# EasyEDA Pro project ProProject_F4_2025-05-21.epro, schematic Schematic3
Create Date: 2024-12-17; Page Name: P1; Project Name: 25电赛备赛; Schematic Name: Schematic3; Update Date: 2025-01-24; Company: 嘉立创EDA; Page Size: A4; Version: V1.0
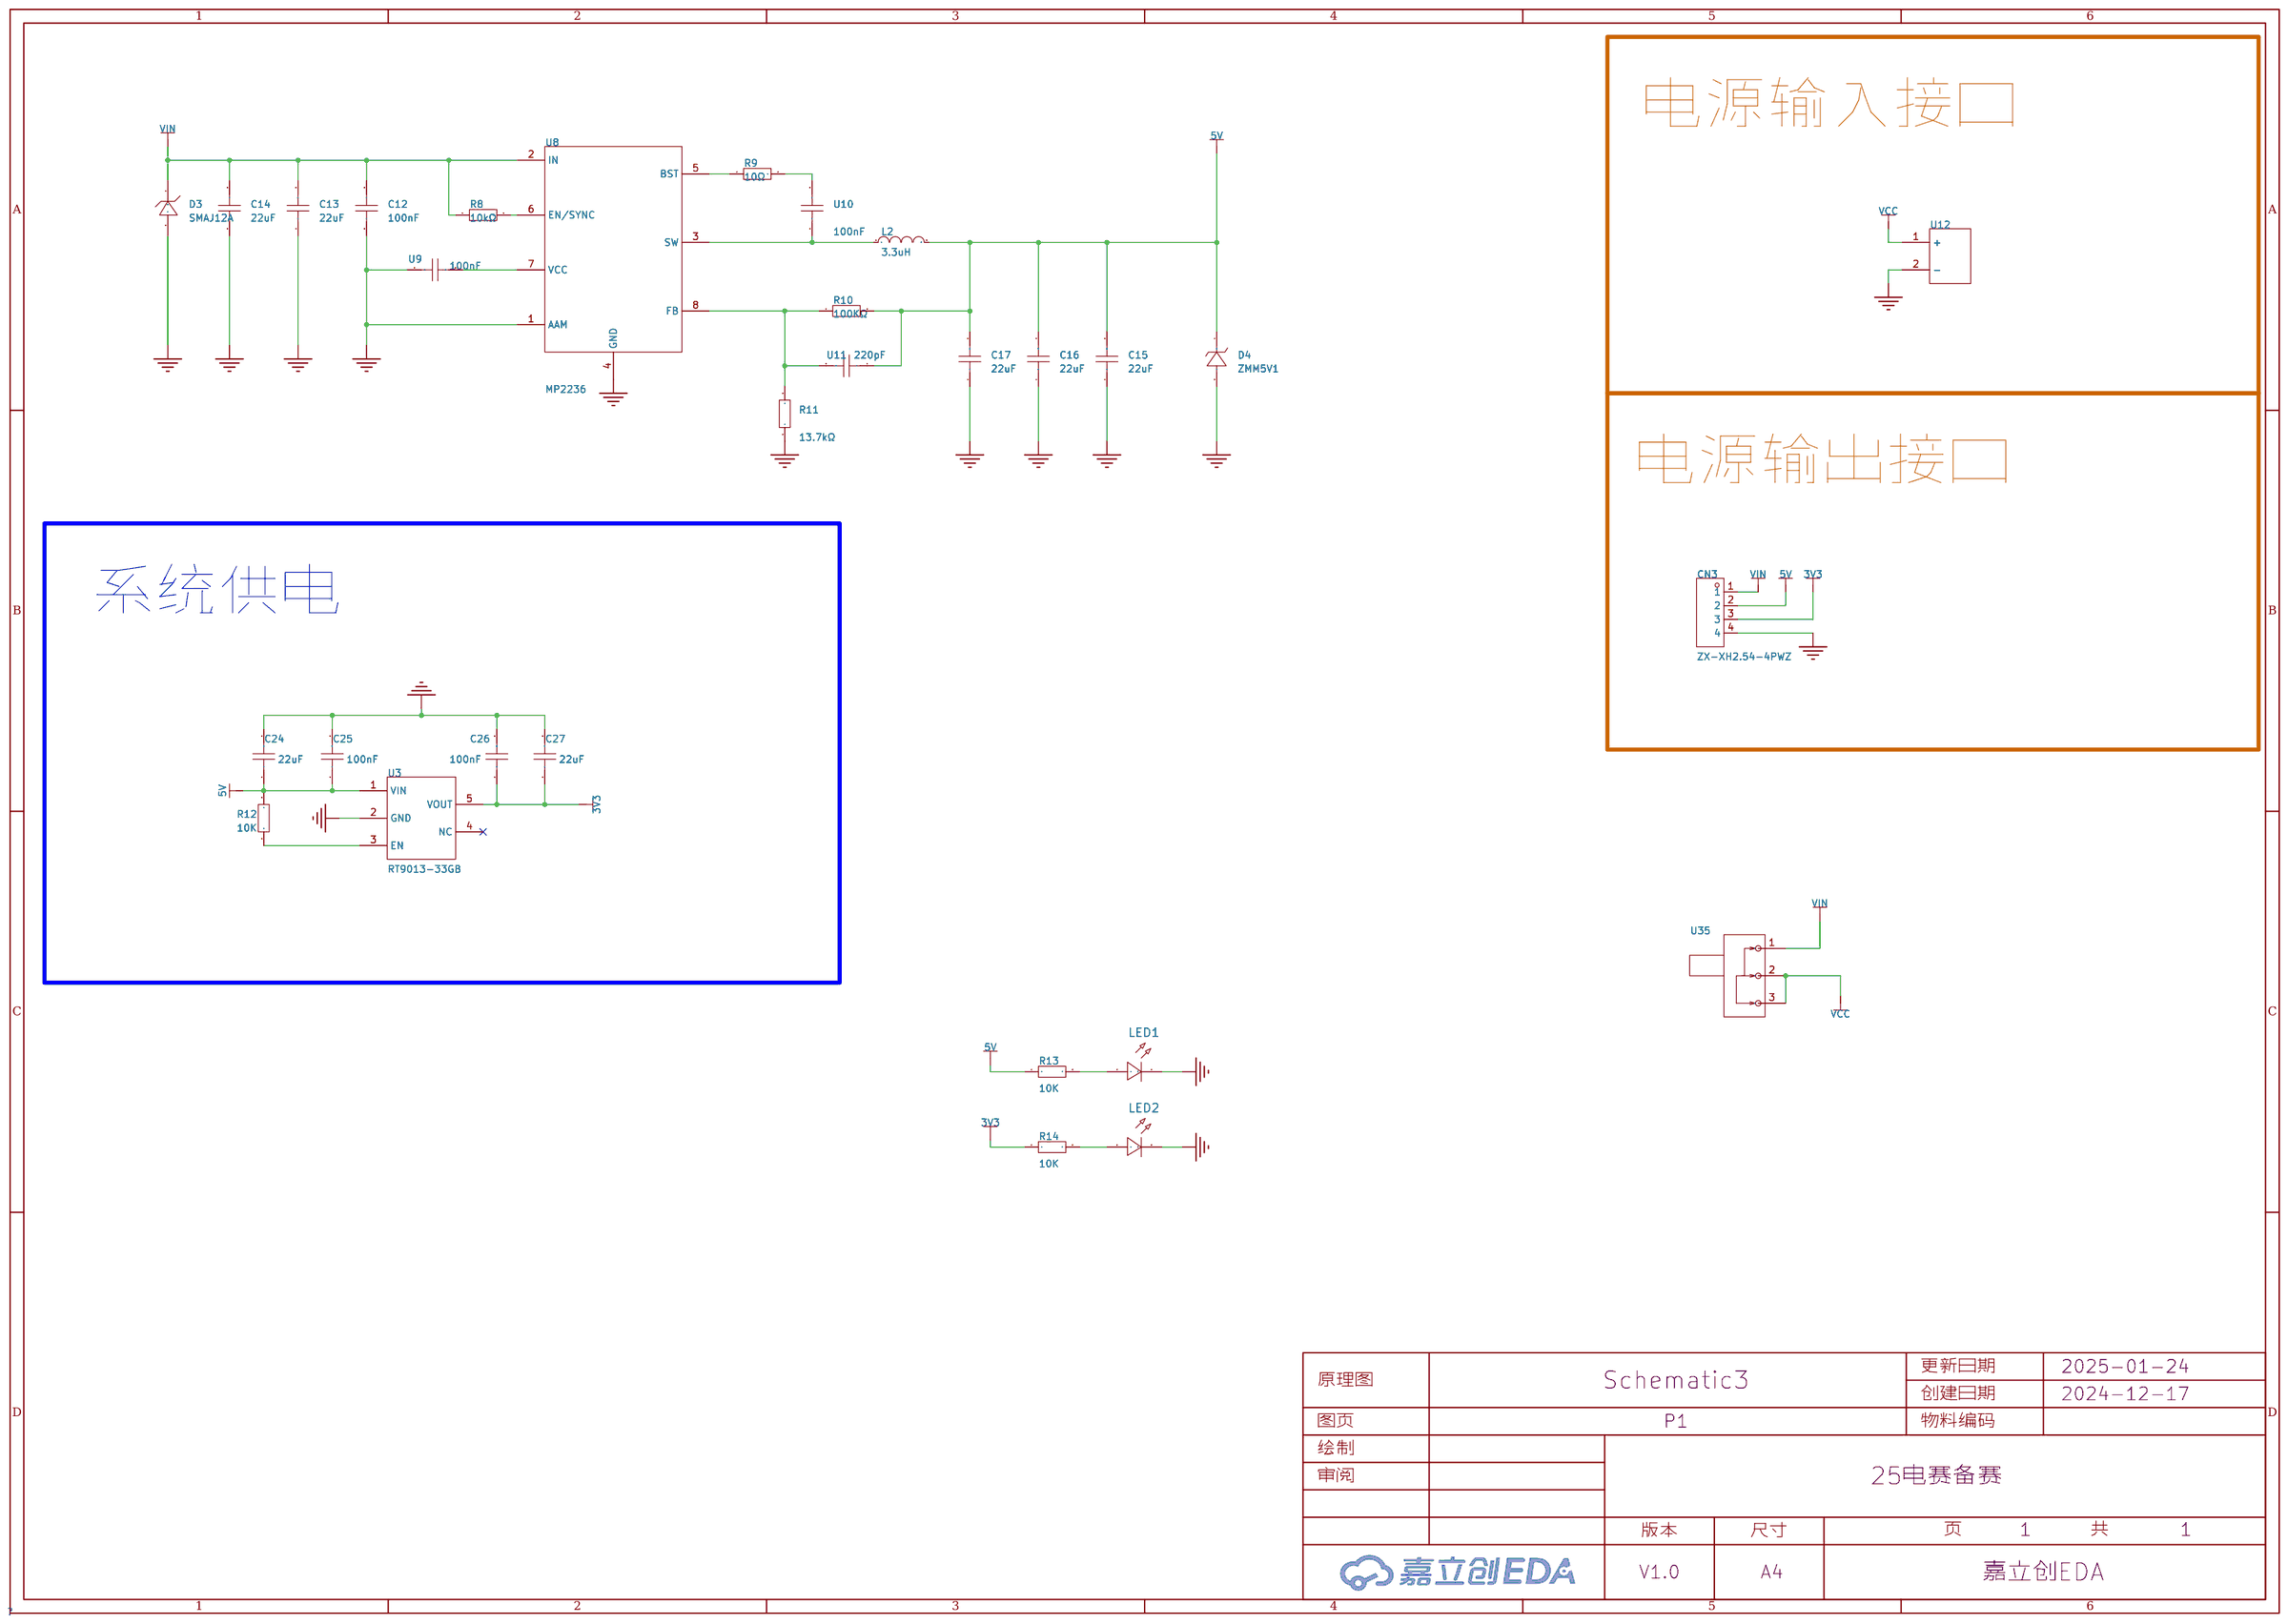
[diagram p2: schematic sheet]

## Parts
C12  100nF  [C0805]
C13  22uF  [C0805]
C14  22uF  [C0805]
C15  22uF  [C0805]
C16  22uF  [C0805]
C17  22uF  [C0805]
C24  22uF  [C0805]
C25  100nF  [C0603]
C26  100nF  [C0603]
C27  22uF  [C0805]
CN3  ZX-XH2.54-4PWZ  [CONN-TH_4P-P2.50_ZX-XH2.54-4PWZ]
D3  SMAJ12A  [SMA_L4.3-W2.6-LS5.2-RD]
D4  ZMM5V1  [LL-34_L3.5-W1.5-RD]
L2  3.3uH  [IND-SMD_L7.0-W6.6]
LED1  -  [LED_0603]
LED2  -  [LED_0603]
R8  10kΩ  [R0603]
R9  10Ω  [R0603]
R10  100KΩ  [R0603]
R11  13.7kΩ  [R0603]
R12  10K  [R0603]
R13  10K  [R0603]
R14  10K  [R0603]
U3  RT9013-33GB  [SOT-23-5_L3.0-W1.7-P0.95-LS2.8-BL]
U8  MP2236  [TSOT23-8]
U9  100nF  [C0603]
U10  100nF  [C0603]
U11  220pF  [C0603]
U12  -  [T插-卧]
U35  -  [12d18a]

## Library data of the parts
C12-C17 C24 C27 = 0805DS106K250NT: LCSC Part Name: 贴片电容; Supplier Part: C18213216; Manufacturer: FH(风华); Supplier Footprint: 0805; Datasheet: https://atta.szlcsc.com/upload/public/pdf/source/20220211/3FDF6092789FC56E23A16E03DC7301F9.pdf; Supplier: LCSC
C25 C26 = CAP_0603: Supplier Footprint: 0603
CN3 = ZX-XH2.54-4PWZ: 插针结构:1x4P;间距:2.54mm;安装方式:弯插;参考系列:XH;总PIN数:4P;排数:1;每排PIN数:4;行距:-;额定电流:3A;触头材质:黄铜;触头镀层:锡;工作温度范围:-25℃~+85℃;; Supplier Part: C7429643; Manufacturer: Megastar(兆星); Supplier Footprint: 弯插,P=2.54mm; JLCPCB Part Class: 扩展库; Datasheet: https://atta.szlcsc.com/upload/public/pdf/source/20230619/8DC602C7BA46C153FF1BE89D90453879.pdf; Supplier: LCSC; Pins Structure: 1x4P; Pitch: 2.54mm; Mounting Style: 弯插; Reference Series: XH; Number of Pins: 4P; Number of Rows: 1; Number of PINs Per Row: 4; Current Rating (Max): 3A; Contact Material: 黄铜; Contact Plating: 锡; Operating Temperature Range: -25℃~+85℃
D3 = SMAJ12A_C148213: 极性:单向;反向截止电压(Vrwm):12V;最大钳位电压:19.9V;峰值脉冲电流(Ipp)@10/1000us:20.1A;峰值脉冲功率(Ppp)@10/1000us:400W;击穿电压:13.3V;; LCSC Part Name: 单向TVS 12V截止; Supplier Part: C148213; Manufacturer: Littelfuse(美国力特); Supplier Footprint: SMA(DO-214AC); JLCPCB Part Class: 扩展库; Datasheet: https://atta.szlcsc.com/upload/public/pdf/source/20190402/C374025_5ACE77BC72947DF13CF0CBC7F8B57228.pdf; Supplier: LCSC; polarity: 单向; Reverse Stand-Off Voltage (Vrwm): 12V; Maximum Clamping Voltage: 19.9V; Peak Pulse Current (Ipp)@10/1000us: 20.1A; Peak Pulse Power Dissipation (Ppp)@10/1000us: 400W; Breakdown Voltage: 13.3V; Type: TVS
D4 = ZMM5V1_C707194: 稳压值(标称值):-;功率(Pd):500mW;; Supplier Part: C707194; Manufacturer: Slkor(萨科微); Supplier Footprint: LL-34; JLCPCB Part Class: 扩展库; Datasheet: https://atta.szlcsc.com/upload/public/pdf/source/20200721/C707184_776B95022AAA01ECB528B9CFDAFDB27C.pdf; Supplier: LCSC; Reverse Leakage Current (Ir): 100nA@1V; Power Dissipation: 500mW
L2 = FXL0630-3R3-M: 电感值:3.3uH;精度:±20%;额定电流:8.5A;饱和电流(Isat):9.5A;类型:一体成型电感;; LCSC Part Name: 3.3uH ±20% 9.5A; Supplier Part: C167219; Manufacturer: cjiang(长江微电); Supplier Footprint: SMD,6.6x7mm; JLCPCB Part Class: 扩展库; Datasheet: https://atta.szlcsc.com/upload/public/pdf/source/20230516/3A080F5AF8C87BB81C3BA86E5F60E51A.pdf; Supplier: LCSC; Tolerance: ±20%; Rated Current: 8.5A; Saturation Current (Isat): 9.5A; DC Resistance (DCR): 22mΩ; Type: 一体成型电感
LED1 LED2 = LED_0603-R: Supplier Footprint: 0603
R8-R11 = 0603WAF1002T5E: 电阻类型:厚膜电阻;阻值:10kΩ;精度:±1%;功率:100mW;最大工作电压:75V;温度系数:±100ppm/℃;; LCSC Part Name: 厚膜电阻 10kΩ ±1% 100mW; Supplier Part: C25804; Manufacturer: UNI-ROYAL(厚声); Supplier Footprint: 0603; JLCPCB Part Class: 基础库; Datasheet: https://atta.szlcsc.com/upload/public/pdf/source/20200306/C422600_1E6D84923E4A46A82E41ADD87F860B5C.pdf; Supplier: LCSC; Type: 厚膜电阻; Tolerance: ±1%; Power(Watts): 100mW; Overload Voltage (Max): 75V; Temperature Coefficient: ±100ppm/℃; Operating Temperature Range: -55℃~+155℃
R12-R14 = Res_0603: Supplier Footprint: 0603
U3 = RT9013-33GB: 输出类型:固定;最大输入电压:5.5V;输出电压:3.3V;最大输出电流:500mA;电源纹波抑制比(PSRR):50dB@(10kHz);输出极性:正极;; LCSC Part Name: 输入5.5V 输出3.3V 500mA; Supplier Part: C47773; Manufacturer: RICHTEK(立锜); Supplier Footprint: SOT-23-5; JLCPCB Part Class: 扩展库; Datasheet: https://atta.szlcsc.com/upload/public/pdf/source/20150504/1457707282459.pdf; Supplier: LCSC; Output Type: 固定; Maximum Input Voltage: 5.5V; Output Voltage: 3.3V; MAX Output Current: 500mA; Power Supply Rejection Ratio (PSRR): 50dB@(10kHz); Dropout Voltage: 400mV@(500mA); standby current: 50uA; Operating Temperature: -40℃~+85℃; Output Polarity: 正极; Number of Outputs: 1
U8 = MP2236: Pin Type: IN
U9-U11 = 0603DS475K160NT: LCSC Part Name: 贴片电容; Supplier Part: C18213190; Manufacturer: FH(风华); Supplier Footprint: 0603; JLCPCB Part Class: Extended Part; Datasheet: https://atta.szlcsc.com/upload/public/pdf/source/20220211/3FDF6092789FC56E23A16E03DC7301F9.pdf; Supplier: LCSC
U12 = T插-卧
U35 = MSKT-12D18A

## Nets
3V3: C26.1 C27.1 CN3.3 R14.1 U3.5(VOUT)
5V: C15.2 C16.2 C17.2 C24.1 C25.1 CN3.2 D4.1(C) L2.2 R10.2 R12.2 R13.1 U3.1(VIN) U11.1
GND: C12.1 C13.1 C14.1 C15.1 C16.1 C17.1 C24.2 C25.2 C26.2 C27.2 CN3.4 D3.2(A) D4.2(A) LED1.1(C) LED2.1(C) R11.1 U3.2(GND) U8.1(AAM) U8.4(GND) U9.1 U12.2(-)
VCC: U12.1(+) U35.2 U35.3
VIN: C12.2 C13.2 C14.2 CN3.1 D3.1(C) R8.1 U8.2(IN) U35.1
$1N1905: R8.2 U8.6(EN/SYNC)
$1N1907: U8.7(VCC) U9.2
$1N1913: R9.1 U8.5(BST)
$1N1914: R9.2 U10.2
$1N1915: L2.1 U8.3(SW) U10.1
$1N1916: R10.1 R11.2 U8.8(FB) U11.2
$1N6612: R12.1 U3.3(EN)
$1N6905: LED1.2(A) R13.2
$1N7345: LED2.2(A) R14.2

Not connected (* = marked no-connect by the designer): U3 4(NC)*

## Notes on the sheet
- 电源输入接口
- 电源输出接口
- 系统供电
